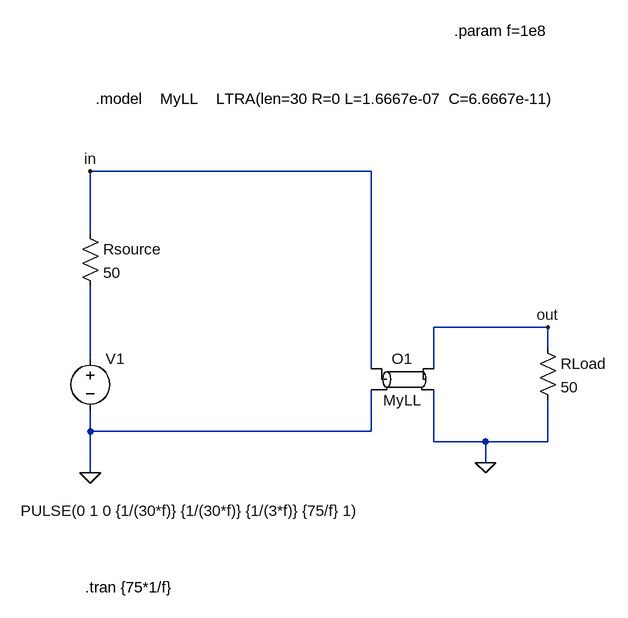
[diagram p0: schematic modelLinieCuP_timp.asc]
modelLinieCuP_timp.asc, the LTspice schematic file:
Version 4
SHEET 1 1172 1048
WIRE -352 320 -784 320
WIRE -784 416 -784 320
WIRE -80 560 -256 560
WIRE -80 592 -80 560
WIRE -784 608 -784 496
WIRE -352 624 -352 320
WIRE -256 624 -256 560
WIRE -784 720 -784 688
WIRE -352 720 -352 656
WIRE -352 720 -784 720
WIRE -256 736 -256 656
WIRE -176 736 -256 736
WIRE -80 736 -80 672
WIRE -80 736 -176 736
WIRE -176 768 -176 736
WIRE -784 784 -784 720
FLAG -784 784 0
FLAG -176 768 0
FLAG -80 560 out
FLAG -784 320 in
SYMBOL res -96 576 R0
SYMATTR InstName RLoad
SYMATTR Value 50
SYMBOL voltage -784 592 R0
WINDOW 123 24 124 Left 2
WINDOW 39 24 44 Left 2
WINDOW 3 -107 250 Left 2
SYMATTR Value PULSE(0 1 0 {1/(30*f)} {1/(30*f)} {1/(3*f)} {75/f} 1)
SYMATTR InstName V1
SYMBOL res -800 400 R0
SYMATTR InstName Rsource
SYMATTR Value 50
SYMBOL ltline -304 640 R0
SYMATTR InstName O1
SYMATTR Value MyLL
TEXT -792 960 Left 2 !.tran {75*1/f}
TEXT -224 104 Left 2 !.param f=1e8
TEXT -776 208 Left 2 !.model    MyLL    LTRA(len=30 R=0 L=1.6667e-07  C=6.6667e-11)

The netlist it stands for:
* modelLinieCuP_timp.asc
RLoad out 0 50
V1 N001 0 PULSE(0 1 0 {1/(30*f)} {1/(30*f)} {1/(3*f)} {75/f} 1)
Rsource in N001 50
O1 in 0 out 0 MyLL
.tran {75*1/f}
.param f=1e8
.model    MyLL    LTRA(len=30 R=0 L=1.6667e-07  C=6.6667e-11)
.backanno
.end